# Altium schematic sheet ANALOG_BUFFER.SchDoc
size A3; SheetNumber: 4; SheetTotal: 9
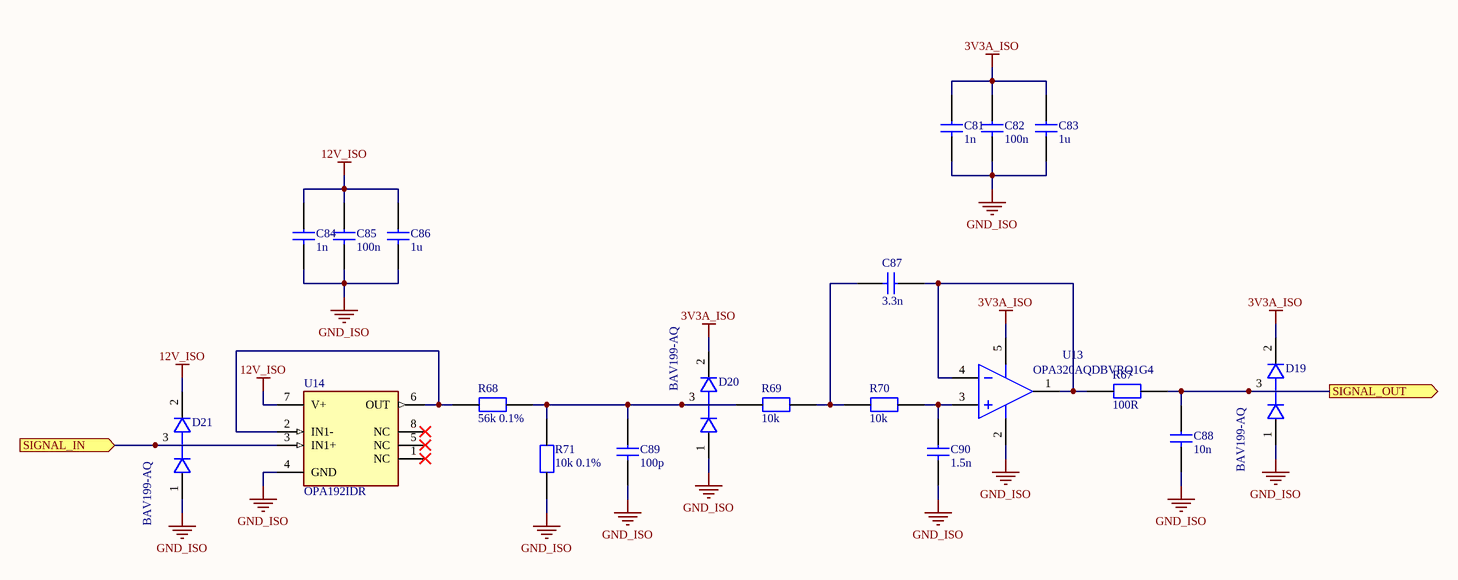
[diagram p0: ANALOG_BUFFER.SchDoc]

## Parts
C81  value 1n  [0603C]  (hidden comment: 1nF 50V X7R 10%)
C82  value 100n  [0603C]  (hidden comment: 100nF 50V X7R 10%)
C83  value 1u  [0603C]  (hidden comment: 1uF 16V X5R 10%)
C84  value 1n  [0603C]  (hidden comment: 1nF 50V X7R 10%)
C85  value 100n  [0603C]  (hidden comment: 100nF 50V X7R 10%)
C86  value 1u  [0603C]  (hidden comment: 1uF 16V X5R 10%)
C87  value 3.3n  [0603C]  (hidden comment: 3.3nF 50V X7R 10%)
C88  value 10n  [0603C]  (hidden comment: 10nF 50V X7R 10%)
C89  value 100p  [0603C]  (hidden comment: 100pF 50V C0G 5%)
C90  value 1.5n  [0603C]  (hidden comment: 1.5nF 50V X5R 5%)
D19  BAV199-AQ  [DIOD-SOT23-3_A_V]
D20  BAV199-AQ  [DIOD-SOT23-3_A_V]
D21  BAV199-AQ  [DIOD-SOT23-3_A_V]
R67  value 100R  [0603R]  (hidden comment: 100R 1% 0.1W)
R68  value 56k 0.1%  [0603R]  (hidden comment: 56k 0.1% 0.1W)
R69  value 10k  [0603R]  (hidden comment: 10k 1% 0.1W)
R70  value 10k  [0603R]  (hidden comment: 10k 1% 0.1W)
R71  value 10k 0.1%  [0603R]  (hidden comment: 10k 0.1% 0.1W)
U13  OPA320AQDBVRQ1G4  [SOT23]
U14  OPA192IDR  [SOIC127P600X175-8N]

## Ports
SIGNAL_IN (in), SIGNAL_OUT (out)

## Nets
3V3A_ISO: C81.2 C82.2 C83.2 D19.2 D20.2 U13.5(+V)
12V_ISO: C84.2 C85.2 C86.2 D21.2 U14.7(V+)
GND_ISO: C81.1 C82.1 C83.1 C84.1 C85.1 C86.1 C88.1 C89.1 C90.1 D19.1 D20.1 D21.1 R71.2 U13.2(-V) U14.4(GND)
SIGNAL_IN: D21.3 U14.3(IN1+) ; port SIGNAL_IN
SIGNAL_OUT: C88.2 D19.3 R67.1 ; port SIGNAL_OUT
NetC87_1: C87.1 R69.2 R70.1
NetC87_2: C87.2 R67.2 U13.1(OUT_A) U13.4(-IN_A)
NetC89_2: C89.2 D20.3 R68.1 R69.1 R71.1
NetC90_2: C90.2 R70.2 U13.3(+IN_A)
NetR68_2: R68.2 U14.2(IN1-) U14.6(OUT)

Not connected (* = marked no-connect by the designer): U14 1(NC)* 5(NC)* 8(NC)*

## Notes on the sheet
- This document and the information it
- contains, including the principles of
- design are the proprietary confidential
- property of MC Electronics.
- Maciej Czerwiński Electronics
- NIP: PL1251711124
- Konopnickiej 16A
- 05-250 Radzymin
- biuro@mcelectronics.biz
- This information is submitted to you
- with the agreement that it is not to be
- disclosed to third parties without prior
- written consent from MC Electronics.
- Acceptance of this document constitutes
- Title:
- greement to these restrictions.
- Date:
- Project ID
- Sheet:
- of
- Module ID -
- Revision
- -
- Size A3

## Library data of the parts
C81 C84 = GEN_1nF_50V_X7R_10%_0603: Generic capacitor 1nF 50V 0603; MC_ID: C00024; Generic: Yes; Mount type: SMT
C82 C85 = GEN_100nF_50V_X7R_10%_0603: Generic capacitor 100n 0603; MC_ID: C00001; Generic: Yes; Mount type: SMT
C83 C86 = GEN_1uF_16V_X5R_10%_0603: Generic capacitor 1u 0603; Generic: Yes; MC_ID: C00017; Mount type: SMT
C87 = GEN_3.3nF_50V_X7R_10%_0603: Generic capacitor 3.3n 0603; MC_ID: C00112; Generic: Yes; Mount type: SMT
C88 = GEN_10nF_50V_X7R_10%_0603: Generic capacitor 10n 0603; Generic: Yes; MC_ID: C00038; Mount type: SMT
C89 = GEN_100pF_50V_C0G_5%_0603: Generic capacitor 100p 0603; MC_ID: C00004; Generic: Yes; Mount type: SMT
C90 = GEN_1.5nF_50V_X5R_5%_0603: Generic capacitor 1.5nF 50V 0603; MC_ID: C00006; Generic: Yes; Mount type: SMT
D19-D21 = BAV199-AQ: Diode Standard Recovery Rectifier 85 Volt 0.16A 3-Pin SOT-23 Tape and Reel; Generic: No; MC_ID: xx; Specific PN: BAV199-AQ; Mount type: SMT
R67 = GEN_100R_1%_0.1W_0603: Generic resistor 100R 0603; MC_ID: R00090; Generic: Yes; Mount type: SMT
R68 = SPEC_56k_0.1%_0.1W_0603: Resistor 56k 0.1% 0603 25ppm/*C; MC_ID: xx; Specific PN: ERA3AEB563V; Generic: Yes; Mount type: SMT
R69 R70 = GEN_10k_1%_0.1W_0603: Generic resistor 10k 0603; MC_ID: R00003; Generic: Yes; Mount type: SMT
R71 = SPEC_10k_0.1%_0.1W_0603: Resistor 10k 0.1% 0603 10ppm/*C; MC_ID: R00258; Specific PN: ERA3ARB103V; Generic: Yes; Mount type: SMT
U13 = OPA320AQDBVRQ1G4: Single low noise Op Amp, 1.8V-5.0V, 20MHz; Generic: No; MC_ID: IC00769; Mount type: SMT; Specific PN: OPA320AQDBVRQ1G4
U14 = OPA192IDR: Wzmacniacz operacyjny; 10MHz; Ch: 1; ±2,25÷18VDC,4,5÷36VDC; MC_ID: xx; Generic: No; Specific PN: OPA192IDR; Mount type: SMT